# EasyEDA Pro project 物联网底板.eprj, schematic Schematic1
Board Name: Board1; Create Date: 2026-05-10; Page Name: P1; Project Name: 物联网底板; Schematic Name: Schematic1; Update Date: 2026-05-19; Company: 嘉立创EDA; Page Size: A4; Version: V1.0
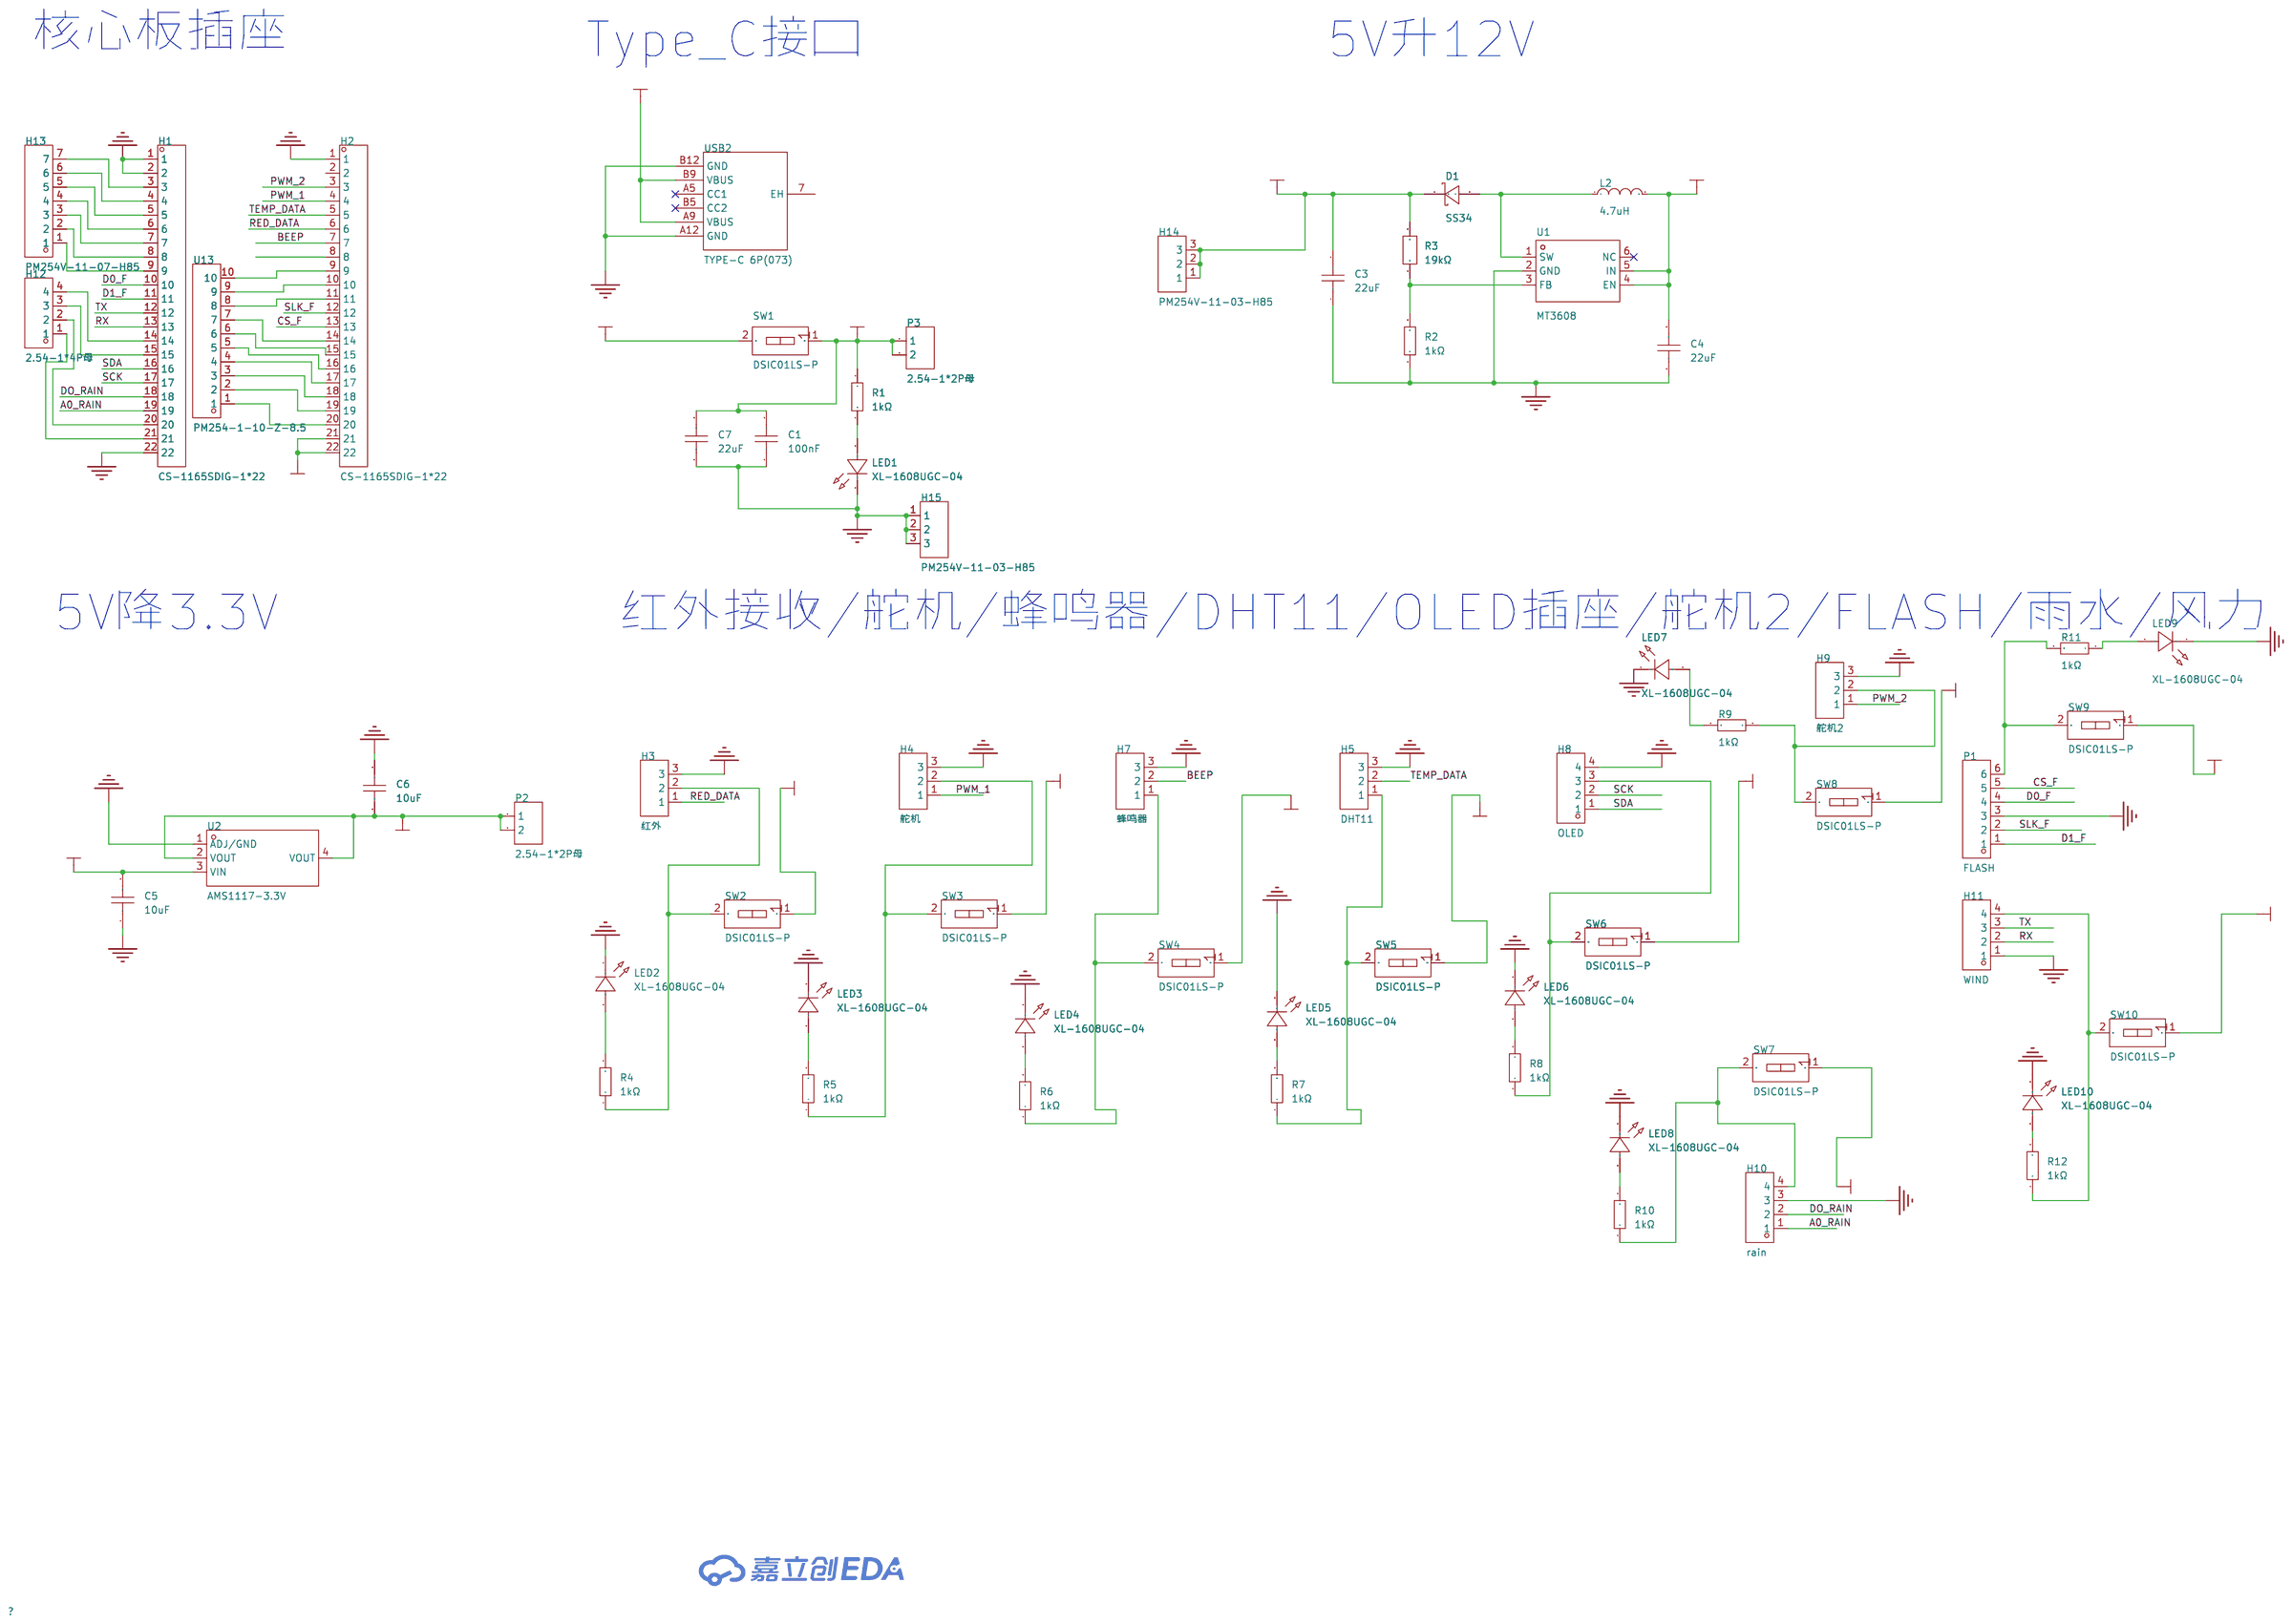
[diagram p0: schematic sheet]

## Parts
C1  100nF  [C0603]
C3  22uF  [C0603]
C4  22uF  [C0603]
C5  10uF  [C0603]
C6  10uF  [C0603]
C7  22uF  [C0603]
D1  SS34  [SMA_L4.3-W2.6-LS5.2-RD]
H1  CS-1165SDIG-1*22  [HDR-TH_22P-P2.54-V-F]
H2  CS-1165SDIG-1*22  [HDR-TH_22P-P2.54-V-F]
H3  红外  [HDR-TH_3P-P2.54-V-F]
H4  舵机  [HDR-TH_3P-P2.54-V-F]
H5  DHT11  [HDR-TH_3P-P2.54-V-F]
H7  蜂鸣器  [HDR-TH_3P-P2.54-V-F]
H8  OLED  [HDR-TH_4P-P2.54-V-F]
H9  舵机2  [HDR-TH_3P-P2.54-V-F]
H10  rain  [HDR-TH_4P-P2.54-V-F]
H11  WIND  [HDR-TH_4P-P2.54-V-F]
H12  2.54-1*4P母  [HDR-TH_4P-P2.54-V-F]
H13  PM254V-11-07-H85  [HDR-TH_7P-P2.54-V-F]
H14  PM254V-11-03-H85  [HDR-TH_3P-P2.54-V-F]
H15  PM254V-11-03-H85  [HDR-TH_3P-P2.54-V-F]
L2  4.7uH  [IND-SMD_L2.5-W2.0-VLS252012CX-150M]
LED1  XL-1608UGC-04  [LED0603-RD_GREEN]
LED2  XL-1608UGC-04  [LED0603-RD_GREEN]
LED3  XL-1608UGC-04  [LED0603-RD_GREEN]
LED4  XL-1608UGC-04  [LED0603-RD_GREEN]
LED5  XL-1608UGC-04  [LED0603-RD_GREEN]
LED6  XL-1608UGC-04  [LED0603-RD_GREEN]
LED7  XL-1608UGC-04  [LED0603-RD_GREEN]
LED8  XL-1608UGC-04  [LED0603-RD_GREEN]
LED9  XL-1608UGC-04  [LED0603-RD_GREEN]
LED10  XL-1608UGC-04  [LED0603-RD_GREEN]
P1  FLASH  [HDR-TH_6P-P2.54-V-F]
P2  2.54-1*2P母  [HDR-TH_2P-P2.54-V-F]
P3  2.54-1*2P母  [HDR-TH_2P-P2.54-V-F]
R1  1kΩ  [R0603]
R2  1kΩ  [R0603]
R3  19kΩ  [R0805]
R4  1kΩ  [R0603]
R5  1kΩ  [R0603]
R6  1kΩ  [R0603]
R7  1kΩ  [R0603]
R8  1kΩ  [R0603]
R9  1kΩ  [R0603]
R10  1kΩ  [R0603]
R11  1kΩ  [R0603]
R12  1kΩ  [R0603]
SW1  DSIC01LS-P  [SW-SMD_2P-L3.5-W6.1-P2.54-LS9.8]
SW2  DSIC01LS-P  [SW-SMD_2P-L3.5-W6.1-P2.54-LS9.8]
SW3  DSIC01LS-P  [SW-SMD_2P-L3.5-W6.1-P2.54-LS9.8]
SW4  DSIC01LS-P  [SW-SMD_2P-L3.5-W6.1-P2.54-LS9.8]
SW5  DSIC01LS-P  [SW-SMD_2P-L3.5-W6.1-P2.54-LS9.8]
SW6  DSIC01LS-P  [SW-SMD_2P-L3.5-W6.1-P2.54-LS9.8]
SW7  DSIC01LS-P  [SW-SMD_2P-L3.5-W6.1-P2.54-LS9.8]
SW8  DSIC01LS-P  [SW-SMD_2P-L3.5-W6.1-P2.54-LS9.8]
SW9  DSIC01LS-P  [SW-SMD_2P-L3.5-W6.1-P2.54-LS9.8]
SW10  DSIC01LS-P  [SW-SMD_2P-L3.5-W6.1-P2.54-LS9.8]
U1  MT3608  [SOT-23-6_L2.9-W1.6-P0.95-LS2.8-BL]
U2  AMS1117-3.3V  [SOT-223-4_L6.5-W3.5-P2.30-LS7.0-TR]
U13  PM254-1-10-Z-8.5  [HDR-TH_10P-P2.54-V-F]
USB2  TYPE-C 6P(073)  [TYPE-C-SMD_TYPE-C-6P-073]

## Library data of the parts
C1 = CC0603KRX7R9BB104: LCSC Part Name: 100nF ±10% 50V; Supplier Part: C14663; Manufacturer: YAGEO(国巨); Supplier Footprint: 0603; JLCPCB Part Class: 基础库; Datasheet: https://item.szlcsc.com/datasheet/CC0603KRX7R9BB104/15331.html; Supplier: LCSC; Tolerance: ±10%; Voltage Rating: 50V; Temperature Coefficient: X7R
C3 C4 C7 = CL10A226MQ8NRNC: LCSC Part Name: 22uF ±20% 6.3V; Supplier Part: C59461; Manufacturer: SAMSUNG(三星); Supplier Footprint: 0603; JLCPCB Part Class: 基础库; Datasheet: https://item.szlcsc.com/datasheet/CL10A226MQ8NRNC/60514.html; Supplier: LCSC; Tolerance: ±20%; Voltage Rating: 6.3V; Temperature Coefficient: X5R
C5 C6 = CL10A106MA8NRNC: LCSC Part Name: 10uF ±20% 25V; Supplier Part: C96446; Manufacturer: SAMSUNG(三星); Supplier Footprint: 0603; JLCPCB Part Class: 基础库; Datasheet: https://item.szlcsc.com/datasheet/CL10A106MA8NRNC/97651.html; Supplier: LCSC; Tolerance: ±20%; Voltage Rating: 25V; Temperature Coefficient: X5R
D1 = SS34_C8678: LCSC Part Name: 电压:40V 电流:3A; Supplier Part: C8678; Manufacturer: MDD(辰达半导体); Supplier Footprint: SMA(DO-214AC); JLCPCB Part Class: 基础库; Datasheet: https://item.szlcsc.com/datasheet/SS34/9178.html; Supplier: LCSC; Diode Configuration: 独立式; Voltage - Forward(Vf@If): 550mV@3A; Voltage - DC Reverse(Vr): 40V; Current - Rectified: 3A; Reverse Leakage Current (Ir): 500uA@40V; Operating Junction Temperature Range: -55℃~+125℃
H1 H2 = CS-1165SDIG-1*22: LCSC Part Name: 间距:2.54mm 1x22P 直插; Supplier Part: C2886702; Manufacturer: CST(永丰盈); Supplier Footprint: 插件,P=2.54mm; JLCPCB Part Class: 扩展库; Datasheet: https://item.szlcsc.com/datasheet/CS-1165SDIG-1*22/3101052.html; Supplier: LCSC; Holes Structure: 1x22P; Pitch: 2.54mm; Circular Hole / Square Hole: 方孔; Mounting Type: 直插; Number of Rows: 单排; Number of Positions: 22P; Current Rating: 3A; Voltage Rating (Max): 250V; Holes Direction: 顶部; Insulation Height: 8.5mm; Operating Temperature: -40℃~+105℃
H3-H5 H7 H9 H14 H15 = PM254V-11-03-H85: LCSC Part Name: 1x3P 间距:2.54mm 直插; Supplier Part: C541850; Manufacturer: XFCN(兴飞); Supplier Footprint: 插件,P=2.54mm; JLCPCB Part Class: 扩展库; Datasheet: https://item.szlcsc.com/datasheet/PM254V-11-03-H85/562471.html; Supplier: LCSC; Holes Structure: 1x3P; Pitch: 2.54mm; Circular Hole / Square Hole: 方孔; Mounting Type: 直插; Number of Rows: 单排; Number of Positions: 3P; Current Rating: 3A; Holes Direction: 顶部; Insulation Height: 8.5mm; Contact Material: 黄铜; Operating Temperature: -40℃~+105℃
H8 H10-H12 = 2.54-1*4P母: LCSC Part Name: 间距:2.54mm 1x4P 直插; Supplier Part: C2718488; Manufacturer: BOOMELE(博穆精密); Supplier Footprint: 插件,P=2.54mm; JLCPCB Part Class: 扩展库; Datasheet: https://item.szlcsc.com/datasheet/2.54-1*4P%25E6%25AF%258D/2834502.html; Supplier: LCSC; Holes Structure: 1x4P; Pitch: 2.54mm; Circular Hole / Square Hole: 方孔; Mounting Type: 直插; Number of Rows: 单排; Number of Positions: 4P; Current Rating: 3A; Holes Direction: 顶部; Contact Material: 青铜; Operating Temperature: -40℃~+105℃
H13 = PM254V-11-07-H85: LCSC Part Name: 间距:2.54mm 1x7P 直插; Supplier Part: C2832270; Manufacturer: XFCN(兴飞); Supplier Footprint: 插件,P=2.54mm; JLCPCB Part Class: 扩展库; Datasheet: https://item.szlcsc.com/datasheet/PM254V-11-07-H85/2989788.html; Supplier: LCSC; Holes Structure: 1x7P; Pitch: 2.54mm; Circular Hole / Square Hole: 方孔; Mounting Type: 直插; Number of Rows: 单排; Number of Positions: 7P; Current Rating: 3A; Voltage Rating (Max): 250V; Holes Direction: 顶部; Operating Temperature: -40℃~+105℃
L2 = FTC252010S4R7MBCA: LCSC Part Name: 4.7uH ±20% 2.6A; Supplier Part: C5832360; Manufacturer: cjiang(长江微电); Supplier Footprint: 1008; JLCPCB Part Class: 扩展库; Datasheet: https://item.szlcsc.com/datasheet/FTC252010S4R7MBCA/6763480.html; Supplier: LCSC; Tolerance: ±20%; Current Rating: 2A; Current - Saturation(Isat): 2.6A; DC Resistance(DCR): 160mΩ
LED1-LED10 = XL-1608UGC-04: LCSC Part Name: 0603翠绿贴片式发光二极管; Supplier Part: C965804; Manufacturer: XINGLIGHT(成兴光); Supplier Footprint: 0603; JLCPCB Part Class: 扩展库; Datasheet: https://item.szlcsc.com/datasheet/XL-1608UGC-04/1051413.html; Supplier: LCSC; Lamp Holder Type: 1.6mmx0.8mm方形灯头; Illumination Color: 翠绿色; Voltage - Forward(Vf): 3.3V; Power(Watts): 70mW; Forward Current: 20mA; Wavelength - Dominant: 515nm~535nm; Peak Wavelength: 525nm; Diode Configuration: 独立二极管; Lens Color: 无色透明透镜; Luminous Intensity: 810mcd; Viewing Angle: 120°; Mounting Style: 正贴; Operating Temperature: -40℃~+85℃
P1 = 2.54-1*6P母: LCSC Part Name: 1x6P 间距:2.54mm 直插; Supplier Part: C40877; Manufacturer: BOOMELE(博穆精密); Supplier Footprint: 插件,P=2.54mm; JLCPCB Part Class: 扩展库; Datasheet: https://item.szlcsc.com/datasheet/2.54-1*6P%25E6%25AF%258D/41861.html; Supplier: LCSC; Holes Structure: 1x6P; Pitch: 2.54mm; Circular Hole / Square Hole: 方孔; Mounting Type: 直插; Number of Rows: 单排; Number of Positions: 6P; Current Rating: 3A; Holes Direction: 顶部; Contact Material: 黄铜; Operating Temperature: -40℃~+105℃; PIN Length: 3.3mm
P2 P3 = 2.54-1*2P母: LCSC Part Name: 1x2P 间距:2.54mm 直插; Supplier Part: C49661; Manufacturer: BOOMELE(博穆精密); Supplier Footprint: 插件,P=2.54mm; JLCPCB Part Class: 扩展库; Datasheet: https://item.szlcsc.com/datasheet/2.54-1*2P%25E6%25AF%258D/50669.html; Supplier: LCSC; Holes Structure: 1x2P; Pitch: 2.54mm; Circular Hole / Square Hole: 方孔; Mounting Type: 直插; Number of Rows: 单排; Number of Positions: 2P; Current Rating: 3A; Holes Direction: 顶部; Contact Material: 黄铜; Operating Temperature: -40℃~+105℃; PIN Length: 3.3mm
R1 R2 R4-R12 = 0603WAF1001T5E: LCSC Part Name: 1kΩ ±1% 100mW 厚膜电阻; Supplier Part: C21190; Manufacturer: UNI-ROYAL(厚声); Supplier Footprint: 0603; JLCPCB Part Class: 基础库; Datasheet: https://item.szlcsc.com/datasheet/0603WAF1001T5E/21904.html; Supplier: LCSC; Type: 厚膜电阻; Tolerance: ±1%; Power(Watts): 100mW; Voltage-Supply(Max): 75V; Temperature Coefficient: ±100ppm/℃; Operating Temperature: -55℃~+155℃
R3 = FRC0805F1902TS: LCSC Part Name: 19kΩ ±1% 125mW 厚膜电阻; Supplier Part: C2930177; Manufacturer: FOJAN(富捷); Supplier Footprint: 0805; JLCPCB Part Class: 扩展库; Supplier: LCSC; Type: 厚膜电阻; Tolerance: ±1%; Power(Watts): 125mW; Voltage-Supply(Max): 150V; Temperature Coefficient: ±100ppm/℃; Operating Temperature: -55℃~+155℃
SW1-SW10 = DSIC01LS-P: LCSC Part Name: 平拨,凸起式 1位拨码开关; Supplier Part: C600988; Manufacturer: XKB Connection(中国星坤); Supplier Footprint: SMD; JLCPCB Part Class: 扩展库; Datasheet: https://item.szlcsc.com/datasheet/DSIC01LS-P/631008.html; Supplier: LCSC; Type: 平拨,凸起式; Circuit: 单刀单掷; Number of Positions: 1位; Termination Style: 鸥翼型; Current Rating: 25mA; Voltage Rating: 24V; Operating Temperature: -20℃~+70℃; Operating Life: 3千次; Color: 黑色
U1 = MT3608: LCSC Part Name: 老版本 高效1.2MHz 2A升压转换器; Supplier Part: C84817; Manufacturer: 西安航天民芯; Supplier Footprint: SOT-23-6; JLCPCB Part Class: 扩展库; Datasheet: https://item.szlcsc.com/datasheet/MT3608/85988.html; Supplier: LCSC; Function: 升压型; Output Type: 可调; Voltage - Supply: 2V~24V; Output Current: 2A; Frequency - Switching: 1.2MHz; Operating Temperature: -40℃~+85℃; Synchronous Rectifier: 否; Number of Outputs: 1; Topology: 升压式; Quiescent Current: 100uA；1.6mA; Switch tube (built-in/external): 内置
U2 = AMS1117-3.3V: LCSC Part Name: 3.3V 1A 12V; Supplier Part: C5120765; Manufacturer: MSKSEMI(美森科); Supplier Footprint: SOT-223; JLCPCB Part Class: 扩展库; Datasheet: https://item.szlcsc.com/datasheet/AMS1117-3.3V/5706124.html; Supplier: LCSC; Output Type: 固定; Voltage - Supply: 12V; Output Voltage: 3.3V; Output Current: 1A; Voltage Dropout: 1.4V@(1A); standby current: 12mA; Features: 过流保护；过热保护; Operating Temperature: 0℃~+125℃@(Ta); Output Configuration: 正极; Number of Outputs: 1
U13 = PM254-1-10-Z-8.5: LCSC Part Name: 1x10P 间距:2.54mm 直插; Supplier Part: C2897373; Manufacturer: HCTL(华灿天禄); Supplier Footprint: 插件,P=2.54mm; JLCPCB Part Class: 扩展库; Datasheet: https://item.szlcsc.com/datasheet/PM254-1-10-Z-8.5/3142378.html; Supplier: LCSC; Holes Structure: 1x10P; Pitch: 2.54mm; Circular Hole / Square Hole: 方孔; Mounting Type: 直插; Number of Rows: 单排; Number of Positions: 10P; Current Rating: 3A; Holes Direction: 顶部; Insulation Height: 8.5mm; Contact Material: 铜合金; Operating Temperature: -40℃~+105℃
USB2 = TYPE-C 6P(073): LCSC Part Name: 6P卧贴母座; Supplier Part: C668623; Manufacturer: SHOU HAN(首韩); Supplier Footprint: SMD; JLCPCB Part Class: 扩展库; Datasheet: https://item.szlcsc.com/datasheet/TYPE-C%25206P(073)/698566.html; Supplier: LCSC; Connector Type: Type-C; Gender: 母; Mounting Type: 卧贴; Number of Contacts: 6P; Number of Ports: 1; Current Rating-Power: 3A; Voltage Rating: 5V; Connect-Disconnect Life: 1万次; Detection color: 黑色; Operating Temperature: -25℃~+85℃

## Nets
3.3V: C6.1 H2.21 H2.22 P2.1 P2.2 SW4.1(PIN1) SW6.1(PIN1) SW9.1(PIN1) SW10.1(PIN1) U2.2(VOUT) U2.4(VOUT)
5V: SW1.2(PIN2) USB2.A9(VBUS) USB2.B9(VBUS)
12V: C3.2 D1.1(K) H14.1 H14.2 H14.3 R3.2
GND: C1.1 C3.1 C4.1 C5.1 C6.2 C7.1 H1.1 H1.2 H1.22 H2.1 H3.3 H4.3 H5.3 H7.3 H8.4 H9.3 H10.3 H11.1 H15.1 H15.2 H15.3 LED1.1(K) LED2.1(K) LED3.1(K) LED4.1(K) LED5.1(K) LED6.1(K) LED7.1(K) LED8.1(K) LED9.1(K) LED10.1(K) P1.3 R2.1 U1.2(GND) U2.1(ADJ/GND) USB2.A12(GND) USB2.B12(GND)
VIN: C1.2 C4.2 C5.2 C7.2 L2.2 P3.1 P3.2 R1.2 SW1.1(PIN1) SW2.1(PIN1) SW3.1(PIN1) SW5.1(PIN1) SW7.1(PIN1) SW8.1(PIN1) U1.4(EN) U1.5(IN) U2.3(VIN)
A0_RAIN: H1.19 H10.1
BEEP: H2.7 H7.2
CS_F: H2.13 P1.5
D0_F: H1.10 P1.4
D1_F: H1.11 P1.1
DO_RAIN: H1.18 H10.2
PWM_1: H2.4 H4.1
PWM_2: H2.3 H9.1
RED_DATA: H2.6 H3.1
RX: H1.13 H11.2
SCK: H1.17 H8.2
SDA: H1.16 H8.1
SLK_F: H2.12 P1.2
TEMP_DATA: H2.5 H5.2
TX: H1.12 H11.3
$1N2366: LED1.2(A) R1.1
$1N3012: R2.2 R3.1 U1.3(FB)
$1N3021: D1.2(A) L2.1 U1.1(SW)
$1N5411: H2.9 U13.10
$1N5418: H2.10 U13.9
$1N5441: H2.11 U13.8
$1N5447: H2.14 U13.7
$1N5454: H2.15 U13.6
$1N5462: H2.16 U13.5
$1N5471: H2.17 U13.4
$1N5478: H2.18 U13.3
$1N5485: H2.19 U13.2
$1N5495: H2.20 U13.1
$1N5602: H1.14 H12.4
$1N5611: H1.15 H12.3
$1N5621: H1.20 H12.2
$1N5630: H1.21 H12.1
$1N5755: H1.9 H13.1
$1N5763: H1.8 H13.2
$1N5773: H1.7 H13.3
$1N5780: H1.6 H13.4
$1N5790: H1.5 H13.5
$1N5797: H1.4 H13.6
$1N5807: H1.3 H13.7
$1N5861: H3.2 R4.1 SW2.2(PIN2)
$1N5982: LED2.2(A) R4.2
$1N6009: H4.2 R5.1 SW3.2(PIN2)
$1N6135: LED3.2(A) R5.2
$1N6161: H7.1 R6.1 SW4.2(PIN2)
$1N6286: LED4.2(A) R6.2
$1N6410: H5.1 R7.1 SW5.2(PIN2)
$1N6420: LED5.2(A) R7.2
$1N6506: H8.3 R8.1 SW6.2(PIN2)
$1N6599: LED6.2(A) R8.2
$1N6654: H9.2 R9.1 SW8.2(PIN2)
$1N6806: LED7.2(A) R9.2
$1N6820: H10.4 R10.1 SW7.2(PIN2)
$1N6926: LED8.2(A) R10.2
$1N6986: P1.6 R11.2 SW9.2(PIN2)
$1N7140: H11.4 R12.1 SW10.2(PIN2)
$1N7229: LED10.2(A) R12.2
$1N16149: LED9.2(A) R11.1

Not connected (* = marked no-connect by the designer): H2 2 8; U1 6(NC)*; USB2 7(EH) A5(CC1)* B5(CC2)*

## Notes on the sheet
- 核心板插座
- Type_C接口
- 5V升12V
- 5V降3.3V
- 红外接收/舵机/蜂鸣器/DHT11/OLED插座/舵机2/FLASH/雨水/风力
